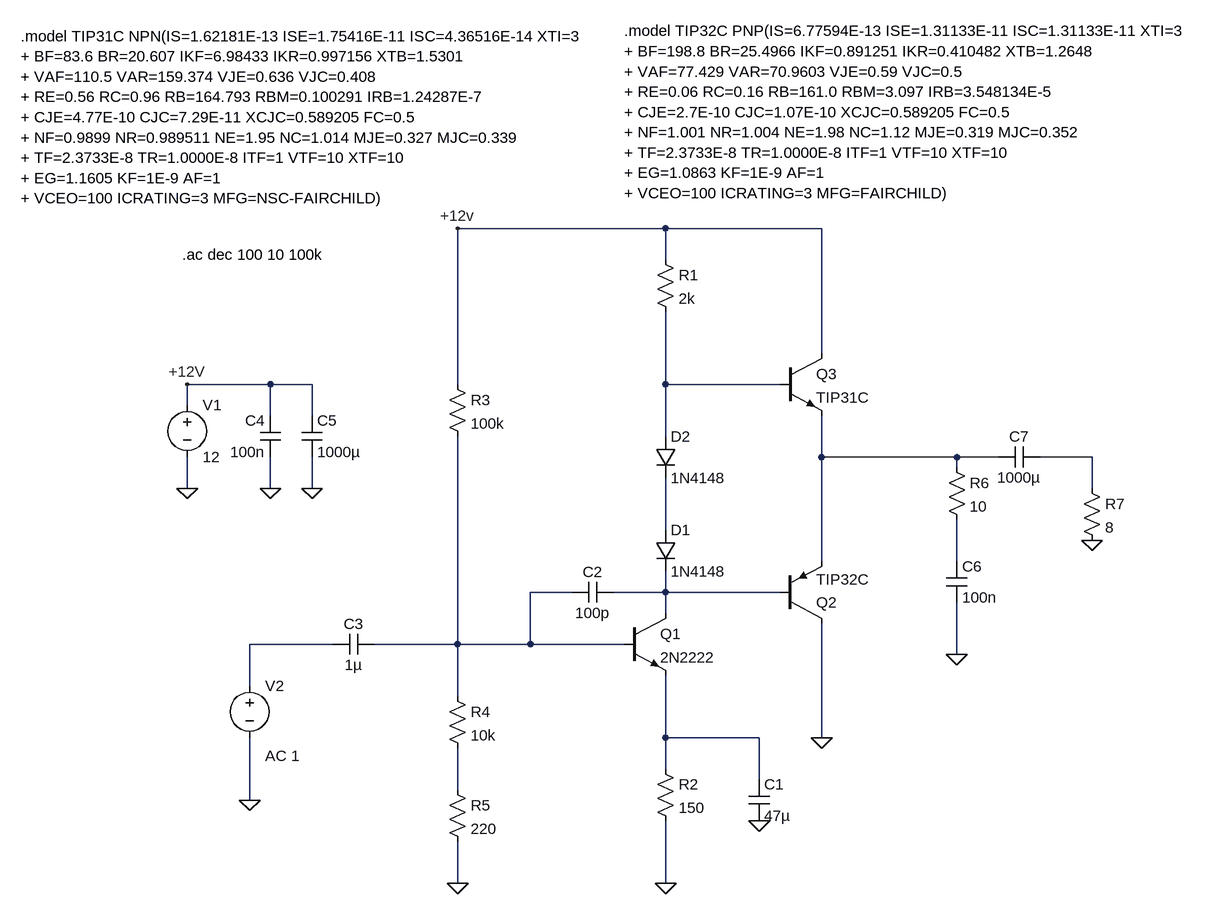
[diagram p0: schematic Simulare_acBode.asc]
Simulare_acBode.asc, the LTspice schematic file:
Version 4.1
SHEET 1 1804 680
WIRE 160 -512 -160 -512
WIRE 400 -512 160 -512
WIRE 160 -464 160 -512
WIRE 400 -320 400 -512
WIRE -448 -272 -576 -272
WIRE -384 -272 -448 -272
WIRE -160 -272 -160 -512
WIRE 160 -272 160 -384
WIRE 336 -272 160 -272
WIRE -576 -240 -576 -272
WIRE -448 -224 -448 -272
WIRE -384 -224 -384 -272
WIRE 160 -192 160 -272
WIRE 400 -160 400 -224
WIRE 608 -160 400 -160
WIRE 672 -160 608 -160
WIRE 816 -160 736 -160
WIRE 608 -144 608 -160
WIRE -576 -112 -576 -160
WIRE -448 -112 -448 -160
WIRE -384 -112 -384 -160
WIRE 816 -112 816 -160
WIRE 160 -48 160 -128
WIRE 400 0 400 -160
WIRE 608 0 608 -64
WIRE 16 48 -48 48
WIRE 160 48 160 16
WIRE 160 48 80 48
WIRE 336 48 160 48
WIRE 160 80 160 48
WIRE -352 128 -480 128
WIRE -160 128 -160 -192
WIRE -160 128 -288 128
WIRE -48 128 -48 48
WIRE -48 128 -160 128
WIRE 96 128 -48 128
WIRE 608 144 608 64
WIRE -480 192 -480 128
WIRE -160 208 -160 128
WIRE 160 272 160 176
WIRE 304 272 160 272
WIRE 400 272 400 96
WIRE 160 320 160 272
WIRE 304 336 304 272
WIRE -160 352 -160 288
WIRE -480 368 -480 272
WIRE -160 496 -160 432
WIRE 160 496 160 400
FLAG -576 -112 0
FLAG -576 -272 +12V
FLAG 160 496 0
FLAG 400 272 0
FLAG 304 400 0
FLAG -160 496 0
FLAG -448 -112 0
FLAG -384 -112 0
FLAG -480 368 0
FLAG 608 144 0
FLAG 816 -32 0
FLAG -160 -512 +12v
SYMBOL npn 96 80 R0
SYMATTR InstName Q1
SYMATTR Value 2N2222
SYMBOL diode 144 -48 R0
SYMATTR InstName D1
SYMATTR Value 1N4148
SYMBOL diode 144 -192 R0
SYMATTR InstName D2
SYMATTR Value 1N4148
SYMBOL npn 336 -320 R0
SYMATTR InstName Q3
SYMATTR Value TIP31C
SYMBOL res 144 -480 R0
SYMATTR InstName R1
SYMATTR Value 2k
SYMBOL res 144 304 R0
SYMATTR InstName R2
SYMATTR Value 150
SYMBOL cap 288 336 R0
SYMATTR InstName C1
SYMATTR Value 47µ
SYMBOL cap 80 32 R90
WINDOW 0 0 32 VBottom 2
WINDOW 3 32 32 VTop 2
SYMATTR InstName C2
SYMATTR Value 100p
SYMBOL voltage -576 -256 R0
WINDOW 123 0 0 Left 0
WINDOW 39 0 0 Left 0
SYMATTR InstName V1
SYMATTR Value 12
SYMBOL res -176 -288 R0
SYMATTR InstName R3
SYMATTR Value 100k
SYMBOL res -176 192 R0
SYMATTR InstName R4
SYMATTR Value 10k
SYMBOL res -176 336 R0
SYMATTR InstName R5
SYMATTR Value 220
SYMBOL cap -288 112 R90
WINDOW 0 0 32 VBottom 2
WINDOW 3 32 32 VTop 2
SYMATTR InstName C3
SYMATTR Value 1µ
SYMBOL cap -432 -160 R180
WINDOW 0 24 56 Left 2
WINDOW 3 24 8 Left 2
SYMATTR InstName C4
SYMATTR Value 100n
SYMBOL cap -400 -224 R0
SYMATTR InstName C5
SYMATTR Value 1000µ
SYMBOL voltage -480 176 R0
WINDOW 123 24 124 Left 2
WINDOW 39 0 0 Left 0
SYMATTR Value2 AC 1
SYMATTR InstName V2
SYMATTR Value ""
SYMBOL res 592 -160 R0
SYMATTR InstName R6
SYMATTR Value 10
SYMBOL cap 592 0 R0
SYMATTR InstName C6
SYMATTR Value 100n
SYMBOL cap 736 -176 R90
WINDOW 0 0 32 VBottom 2
WINDOW 3 32 32 VTop 2
SYMATTR InstName C7
SYMATTR Value 1000µ
SYMBOL res 800 -128 R0
SYMATTR InstName R7
SYMATTR Value 8
SYMBOL pnp 336 96 M180
SYMATTR InstName Q2
SYMATTR Value TIP32C
TEXT -832 -808 Left 2 !.model TIP31C NPN(IS=1.62181E-13 ISE=1.75416E-11 ISC=4.36516E-14 XTI=3\n+ BF=83.6 BR=20.607 IKF=6.98433 IKR=0.997156 XTB=1.5301\n+ VAF=110.5 VAR=159.374 VJE=0.636 VJC=0.408\n+ RE=0.56 RC=0.96 RB=164.793 RBM=0.100291 IRB=1.24287E-7\n+ CJE=4.77E-10 CJC=7.29E-11 XCJC=0.589205 FC=0.5\n+ NF=0.9899 NR=0.989511 NE=1.95 NC=1.014 MJE=0.327 MJC=0.339\n+ TF=2.3733E-8 TR=1.0000E-8 ITF=1 VTF=10 XTF=10\n+ EG=1.1605 KF=1E-9 AF=1\n+ VCEO=100 ICRATING=3 MFG=NSC-FAIRCHILD)
TEXT 96 -816 Left 2 !.model TIP32C PNP(IS=6.77594E-13 ISE=1.31133E-11 ISC=1.31133E-11 XTI=3\n+ BF=198.8 BR=25.4966 IKF=0.891251 IKR=0.410482 XTB=1.2648\n+ VAF=77.429 VAR=70.9603 VJE=0.59 VJC=0.5\n+ RE=0.06 RC=0.16 RB=161.0 RBM=3.097 IRB=3.548134E-5\n+ CJE=2.7E-10 CJC=1.07E-10 XCJC=0.589205 FC=0.5\n+ NF=1.001 NR=1.004 NE=1.98 NC=1.12 MJE=0.319 MJC=0.352\n+ TF=2.3733E-8 TR=1.0000E-8 ITF=1 VTF=10 XTF=10\n+ EG=1.0863 KF=1E-9 AF=1\n+ VCEO=100 ICRATING=3 MFG=FAIRCHILD)
TEXT -584 -472 Left 2 !.ac dec 100 10 100k

The netlist it stands for:
* Simulare_acBode.asc
Q1 N007 N006 N009 0 2N2222
D1 N004 N007 1N4148
D2 N001 N004 1N4148
Q3 +12V N001 N002 0 TIP31C
R1 +12V N001 2k
R2 N009 0 150
C1 N009 0 47µ
C2 N007 N006 100p
V1 +12V 0 12
R3 +12V N006 100k
R4 N006 N010 10k
R5 N010 0 220
C3 N006 N008 1µ
C4 0 +12V 100n
C5 +12V 0 1000µ
V2 N008 0 AC 1
R6 N002 N005 10
C6 N005 0 100n
C7 N003 N002 1000µ
R7 N003 0 8
Q2 0 N007 N002 0 TIP32C
.model D D
.lib standard.dio
.model NPN NPN
.model PNP PNP
.lib standard.bjt
.model TIP31C NPN(IS=1.62181E-13 ISE=1.75416E-11 ISC=4.36516E-14 XTI=3
+ BF=83.6 BR=20.607 IKF=6.98433 IKR=0.997156 XTB=1.5301
+ VAF=110.5 VAR=159.374 VJE=0.636 VJC=0.408
+ RE=0.56 RC=0.96 RB=164.793 RBM=0.100291 IRB=1.24287E-7
+ CJE=4.77E-10 CJC=7.29E-11 XCJC=0.589205 FC=0.5
+ NF=0.9899 NR=0.989511 NE=1.95 NC=1.014 MJE=0.327 MJC=0.339
+ TF=2.3733E-8 TR=1.0000E-8 ITF=1 VTF=10 XTF=10
+ EG=1.1605 KF=1E-9 AF=1
+ VCEO=100 ICRATING=3 MFG=NSC-FAIRCHILD)
.model TIP32C PNP(IS=6.77594E-13 ISE=1.31133E-11 ISC=1.31133E-11 XTI=3
+ BF=198.8 BR=25.4966 IKF=0.891251 IKR=0.410482 XTB=1.2648
+ VAF=77.429 VAR=70.9603 VJE=0.59 VJC=0.5
+ RE=0.06 RC=0.16 RB=161.0 RBM=3.097 IRB=3.548134E-5
+ CJE=2.7E-10 CJC=1.07E-10 XCJC=0.589205 FC=0.5
+ NF=1.001 NR=1.004 NE=1.98 NC=1.12 MJE=0.319 MJC=0.352
+ TF=2.3733E-8 TR=1.0000E-8 ITF=1 VTF=10 XTF=10
+ EG=1.0863 KF=1E-9 AF=1
+ VCEO=100 ICRATING=3 MFG=FAIRCHILD)
.ac dec 100 10 100k
.backanno
.end